# Altium schematic sheet Audio_Amplifier_Section.SchDoc
size A4; DocumentNumber: 9; SheetNumber: 9; SheetTotal: 9
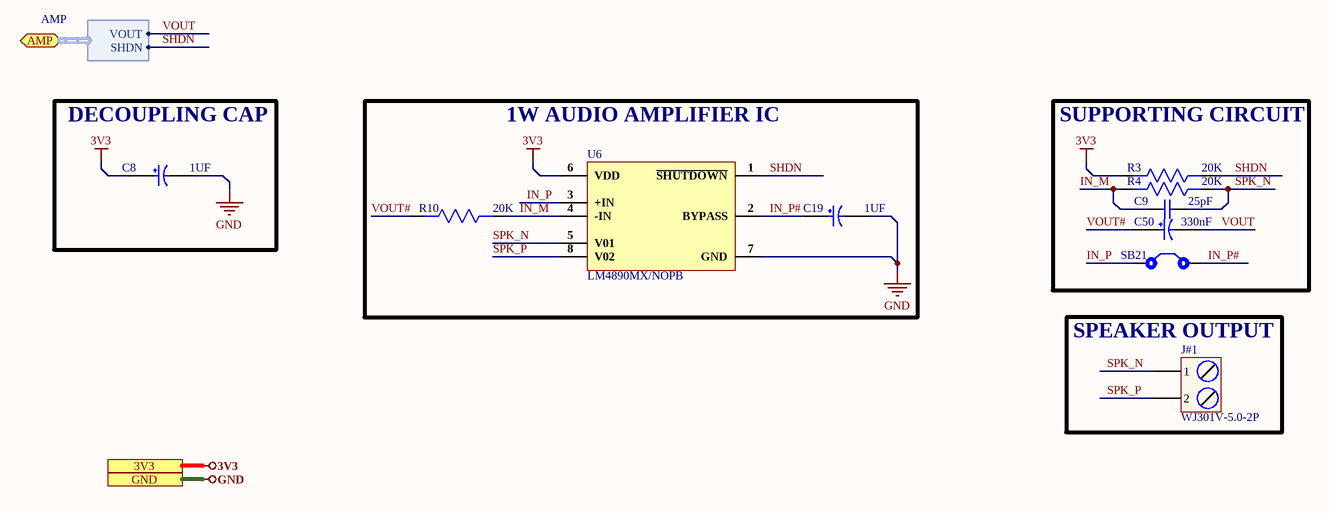
[diagram p0: Audio_Amplifier_Section.SchDoc]

## Parts
C8  1UF  [TCP1A105M8R]
C9  25pF  [Cap 0603]
C19  1UF  [TCP1A105M8R]
C50  330nF  [TCTU1D334M8R]
J#1  WJ301V-5.0-2P  [WJ301V-5.0-2P]
R3  20K  [Res0402]
R4  20K  [Res0402]
R10  20K  [Res0402]
SB21  Solder Bridge  [Solder Bridge]  (value not drawn)
U6  LM4890MX/NOPB  [SOIC-8]

## Blocks framed on the sheet
DECOUPLING CAP: C8
1W AUDIO AMPLIFIER IC: C19 R10 U6
SUPPORTING CIRCUIT: C9 C50 R3 R4 SB21
SPEAKER OUTPUT: J#1

## Ports
3V3, AMP (bidir, harness AMP), GND

## Harnesses
AMP: VOUT, SHDN

## Nets
3V3: C8.1 R3.2 U6.6(VDD) ; port 3V3
GND: C8.2 C19.2 U6.7(GND) ; port GND
IN_M: C9.1 R4.2 R10.1 U6.4(-IN)
IN_P: SB21.1 U6.3(+IN)
IN_P#: C19.1 SB21.2 U6.2(BYPASS)
SHDN: R3.1 U6.1(~{SHUTDO}~{WN}) ; port AMP.SHDN
SPK_N: C9.2 J#1.1 R4.1 U6.5(V01)
SPK_P: J#1.2 U6.8(V02)
VOUT: C50.2 ; port AMP.VOUT
VOUT#: C50.1 R10.2

## Notes on the sheet
- 1
- Huzaifa Ali

## Library data of the parts
C8 C19 = TCP1A105M8R: 1uF 10V ±20% 0805 Tantalum Capacitors ROHS; Manufacturer: ROHM; Manufacturer Part No: TCP1A105M8R; Package: 0805; Value: 1uF; ComponentLink1Description: LCSC; ComponentLink1URL: https://lcsc.com/product-detail/Tantalum-Capacitors_ROHM-Semicon-TCP1A105M8R_C1952948.html
C9 = CC0603JRNPO9BN250: CAP CER 25PF 50V C0G/NPO 0603; Manufacturer: YAGEO; Manufacturer Part No: CC0603JRNPO9BN250; Package: 0603; Value: 25pF
C50 = TCTU1D334M8R: CAP TANT 0.33 uF 20 V ±20% 0402; Manufacturer: Rohm; Voltage Rating: 20V; Leakage Current: 700nA; Supplier 1: Digi-Key; Manufacturer Part Number: TCTU1D334M8R; RoHS: Yes; Category: Tantalum Capacitors; Stock 1: 28079; Pricing 1: 1=0.52000, 10=0.36800, 50=0.27800, 100=0.24220, 500=0.17940, 1000=0.15249, 2500=0.14352, 5000=0.13455 (USD); Mount: Surface Mount; Case/Package: 0402; Case Code (Metric): 1005; Case Code (Imperial): 0402; Min Operating Temperature: -55°C; Max Operating Temperature: 125°C; Package Quantity: 10000; Packaging: Tape and Reel; Capacitance: 330nF; Tolerance: 20%; Termination: SMD/SMT; Dissipation Factor: 20%; Voltage Rating (DC): 20V; Features: General Purpose; Length: 0.039inch; Width: 0.5mm; Height: 0.6mm; Height - Seated (Max): 0.024inch; Lead Free: Lead Free; RoHS Compliant: Yes; ComponentLink1URL: https://datasheet.ciiva.com/29503/tct-u-29503913.pdf?src-supplier=Digi-Key; ComponentLink1Description: https://datasheet.ciiva.com/29503/tct-u-29503913.pdf?src-supplier=Digi-Key; ComponentLink2URL: https://datasheet.ciiva.com/29503/tct-u-29503914.pdf?src-supplier=Digi-Key; ComponentLink2Description: https://datasheet.ciiva.com/29503/tct-u-29503914.pdf?src-supplier=Digi-Key; ComponentLink3URL: https://datasheet.ciiva.com/29503/tct-u-29503915.pdf?src-supplier=Digi-Key; ComponentLink3Description: https://datasheet.ciiva.com/29503/tct-u-29503915.pdf?src-supplier=Digi-Key; Supplier Part Number 1: 511-1684-1-ND
J#1 = WJ301V-5.0-2P: P=5.0mm Screw terminal RoHS; Manufacturer: Ningbo Kangnex Elec; Value: Custom; Manufacturer Part No: WJ301V-5.0-2P; Package: Custom
R3 R4 R10 = RC0402JR-0720KL: RES SMD 20K OHM 5% 1/16W 0402; Manufacturer: Yageo; Resistance: 20kR; Power Rating: 62.5mW; Voltage Rating: 50V; Temperature Coefficient: 100ppm/°C; Max Power Dissipation: 63mW; Supplier 1: Digi-Key; Manufacturer Part Number: RC0402JR-0720KL; Stock 1: 4817510; Pricing 1: 1=0.1, 10=0.013, 100=0.0053, 1000=0.00236, 2500=0.00205, 5000=0.00169 (USD); Case/Package: 0402; Number of Pins: 2; Case Code (Metric): 1005; Case Code (Imperial): 0402; Min Operating Temperature: -55°C; Max Operating Temperature: 155°C; Package Quantity: 1; Tolerance: 5%; Packaging: Tape and Reel; Composition: Thick Film; Number of Terminations: 2; Termination: SMD/SMT; Military Standard: Not; Voltage Rating (DC): 50V; Features: Moisture Resistant; Length: 0.039inch; Height: 0.016inch; Width: 0.02inch; Depth: 0.5mm; REACH SVHC: No SVHC; Lead Free: Lead Free; ComponentLink1URL: http://www.yageo.com/documents/recent/PYu-RC_Group_51_RoHS_L_9.pdf?src-supplier=Digi-Key; ComponentLink1Description: http://www.yageo.com/documents/recent/PYu-RC_Group_51_RoHS_L_9.pdf?src-supplier=Digi-Key; ComponentLink2URL: http://www.farnell.com/datasheets/1018594.pdf?src-supplier=Element14; ComponentLink2Description: http://www.farnell.com/datasheets/1018594.pdf?src-supplier=Element14; ComponentLink3URL: http://www.mouser.com/ds/2/447/PYu-RC0402_51_RoHS_L_6_r-8721.pdf?src-supplier=Mouser; ComponentLink3Description: http://www.mouser.com/ds/2/447/PYu-RC0402_51_RoHS_L_6_r-8721.pdf?src-supplier=Mouser; ComponentLink4URL: http://www.yageo.com/documents/recent/PYu-RC0402_51_RoHS_L_6_r.pdf?src-supplier=Future+Electronics; ComponentLink4Description: http://www.yageo.com/documents/recent/PYu-RC0402_51_RoHS_L_6_r.pdf?src-supplier=Future+Electronics; Supplier Part Number 1: 311-20KJRCT-ND
SB21 = Solder Bridge: Solder Bridge ON
U6 = LM4890MX/NOPB: IC AMP CLASS AB MONO 1W 8SOIC; Manufacturer: Texas Instruments; Manufacturer Part No: LM4890MX/NOPB; Package: SOIC-8_150mil; ComponentLink1Description: LCSC; ComponentLink1URL: https://lcsc.com/product-detail/Audio-Power-OpAmps_Texas-Instruments-LM4890MX-NOPB_C117476.html